# Altium schematic sheet CH9329.SchDoc
size A3
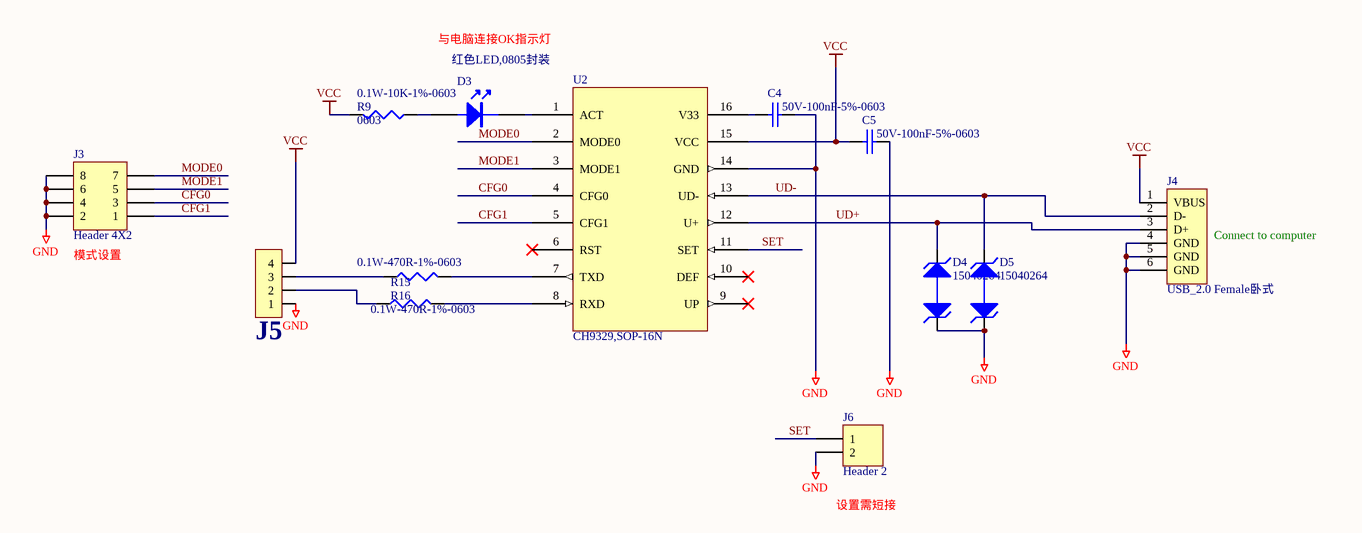
[diagram p0: CH9329.SchDoc]

## Parts
C4  50V-100nF-5%-0603  [0603]
C5  50V-100nF-5%-0603  [0603]
D3  红色LED,0805封装  [0805-D-U]
D4  15040264  [15040264_B]
D5  15040264  [15040264_B]
J3  Header 4X2  [HDR2X4]
J4  USB_2.0 Female卧式  [USB-AM-90度-公头]
J5  CON-4  [SIP-4]  (value not drawn)
J6  Header 2  [HDR1X2]
R9  0.1W-10K-1%-0603  [0603]
R15  0.1W-470R-1%-0603  [0603]
R16  0.1W-470R-1%-0603  [0603]
U2  CH9329,SOP-16N  [SOP-16N]

## Nets
GND: C4.1 C5.1 D4.2(K) D5.2(K) J3.2 J3.4 J3.6 J3.8 J4.4(GND) J4.5(GND) J4.6(GND) J5.1 J6.2 U2.14(GND)
VCC: C5.2 J4.1(VBUS) J5.4 R9.2 U2.15(VCC)
CFG0: J3.3 U2.4(CFG0)
CFG1: J3.1 U2.5(CFG1)
MODE0: J3.7 U2.2(MODE0)
MODE1: J3.5 U2.3(MODE1)
SET: J6.1 U2.11(SET)
UD+: D4.1(A) J4.3(D+) U2.12(U+)
UD-: D5.1(A) J4.2(D-) U2.13(UD-)
NetC4_2: C4.2 U2.16(V33)
NetD3_A: D3.A R9.1
NetD3_K: D3.K U2.1(ACT)
NetJ5_2: J5.2 R16.1
NetJ5_3: J5.3 R15.1
NetR15_2: R15.2 U2.7(TXD)
NetR16_2: R16.2 U2.8(RXD)

Not connected (* = marked no-connect by the designer): U2 6(RST)* 9(UP)* 10(DEF)*

## Notes on the sheet
- 与电脑连接OK指示灯
- (near J3) 模式设置
- (near J4) Connect to computer
- (near J6) 设置需短接

## Library data of the parts
C4 C5 = CAP-?V-?nF-10%-0603: name: 贴片电容; MATNR: 12020100033; unit: PCS; voltage: 50V; accuracy: 10%; value: 50V-100nF-5%-0603
D3 = LED: MATNR: 12030400193; name: 红色LED,; unit: 个; value: 红色LED,0805封装
D4 D5 = DIODE-A
J3 = Header 4X2: Header, 4-Pin, Dual row; LatestRevisionDate: 17-Jul-2002; LatestRevisionNote: Re-released for DXP Platform.; Publisher: Altium Limited
J4 = USB_2.0 Female卧式: 12999900026,USB2.0,A型母座,90度直角,单层; name: USB插座; unit: PCS; value: USB2.0,A型母座,90度直角,单层,卧式; LatestRevisionDate: 17-Jul-2002; LatestRevisionNote: Re-released for DXP Platform.; Publisher: Altium Limited; MATNR: 12999900026
J5 = CON-4: 连接器
J6 = Header 2: Header, 2-Pin; LatestRevisionDate: 17-Jul-2002; LatestRevisionNote: Re-released for DXP Platform.; Publisher: Altium Limited
R9 = RES-0.1W-?R-1%-0603: unit: 个; MATNR: 12010200385; name: 贴片电阻; power: 0.1W; accuracy: 1%; value: 0.1W-10K-1%-0603
R15 R16 = RES-0.1W-?R-1%-0603: unit: 个; MATNR: 12010200353; name: 贴片电阻; power: 0.1W; accuracy: 1%; value: 0.1W-470R-1%-0603
U2 = CH9329: name: 贴片IC; unit: 个; accuracy: *; value: CH9329,SOP-16N